# Altium schematic sheet MCU.SchDoc
size A4
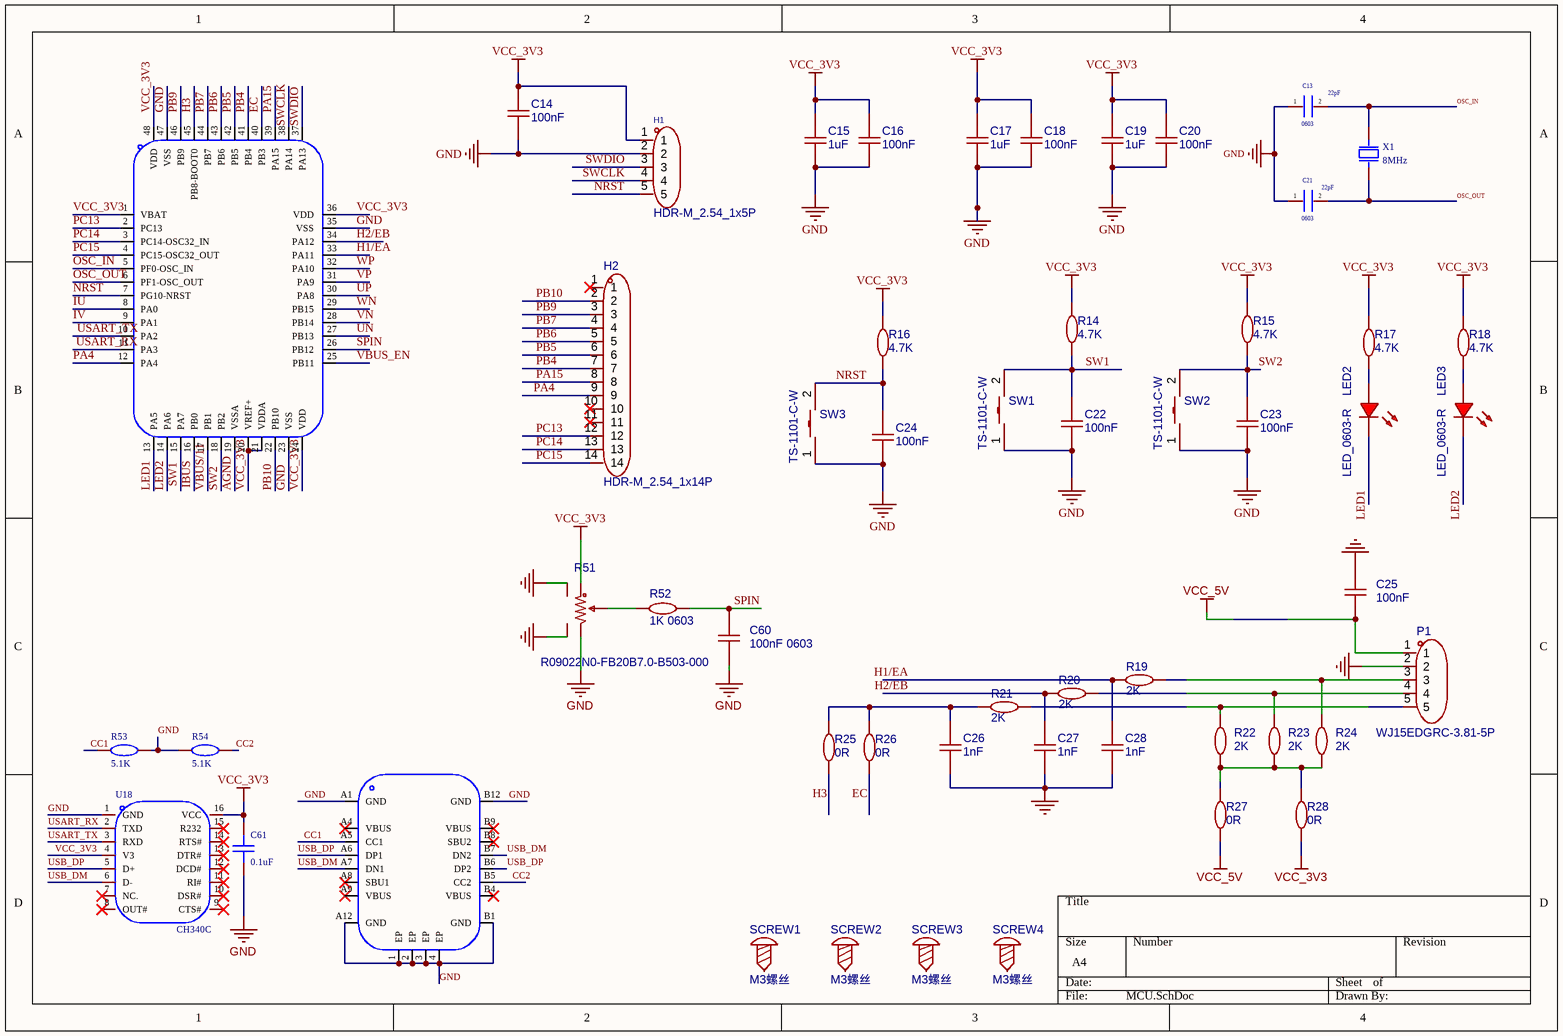
[diagram p0: MCU.SchDoc]

## Parts
C13  value 22pF  Footprint_1: 0603  [C0603]  (hidden comment: My_Library_Cap-0603)
C14  100nF  [C0603]
C15  1uF  [C0603]
C16  100nF  [C0603]
C17  1uF  [C0603]
C18  100nF  [C0603]
C19  1uF  [C0603]
C20  100nF  [C0603]
C21  value 22pF  Footprint_1: 0603  [C0603]  (hidden comment: My_Library_Cap-0603)
C22  100nF  [C0603]
C23  100nF  [C0603]
C24  100nF  [C0603]
C25  100nF  [C0603]
C26  1nF  [C0603]
C27  1nF  [C0603]
C28  1nF  [C0603]
C60  100nF 0603  [C0603]
C61  0.1uF  [C0603]
H1  HDR-M_2.54_1x5P  [HDR-TH_5P-P2.54-V-M]
H2  HDR-M_2.54_1x14P  [HDR-TH_14P-P2.54-V-M]
LED2  LED_0603-R  [LED_0603]
LED3  LED_0603-R  [LED_0603]
P1  WJ15EDGRC-3.81-5P  [CONN-TH_5P-P3.81_WJ15EDGRC-3.81-5P]
R14  4.7K  [R0603]
R15  4.7K  [R0603]
R16  4.7K  [R0603]
R17  4.7K  [R0603]
R18  4.7K  [R0603]
R19  2K  [R0603]
R20  2K  [R0603]
R21  2K  [R0603]
R22  2K  [R0603]
R23  2K  [R0603]
R24  2K  [R0603]
R25  0R  [R0603]
R26  0R  [R0603]
R27  0R  [R0603]
R28  0R  [R0603]
R51  R09022N0-FB20B7.0-B503-000  [RES-ADJ-TH_R09022N0-FB20B7B503-0004]
R52  1K 0603  [R0603]
R53  5.1K  [R0603]
R54  5.1K  [R0603]
SCREW1  M3螺丝  [PCBComponent_1 - duplicate]
SCREW2  M3螺丝  [PCBComponent_1 - duplicate]
SCREW3  M3螺丝  [PCBComponent_1 - duplicate]
SCREW4  M3螺丝  [PCBComponent_1 - duplicate]
SW1  TS-1101-C-W  [SW-SMD_L6.0-W3.3-LS8.0]
SW2  TS-1101-C-W  [SW-SMD_L6.0-W3.3-LS8.0]
SW3  TS-1101-C-W  [SW-SMD_L6.0-W3.3-LS8.0]
U5  stm32g473cbt6  [LQFP-48_L7.0-W7.0-P0.50-LS9.0-BL]  (value not drawn)
U18  CH340C  [SOP-16_L10.0-W3.9-P1.27-LS6.0-BL]
USB1  kh-type-c-16p  [USB-C-SMD_KH-TYPE-C-16P]  (value not drawn)
X1  8MHz  [CRYSTAL-SMD_L11.5-W4.8-LS12.7]

## Nets
GND: C13.1 C14.1 C15.1 C16.1 C17.1 C18.1 C19.1 C20.1 C21.1 C22.1 C23.1 C24.1 C25.2 C26.1 C27.1 C28.1 C60.2 C61.2 H1.2 P1.2 R51.3 R51.4 R51.5 R53.2 R54.1 SW1.1 SW2.1 SW3.1 U5.23(VSS) U5.35(VSS) U5.47(VSS) U18.1(GND) USB1.1(EP) USB1.2(EP) USB1.3(EP) USB1.4(EP) USB1.A1(GND) USB1.A12(GND) USB1.B1(GND) USB1.B12(GND)
VCC_3V3: C14.2 C15.2 C16.2 C17.2 C18.2 C19.2 C20.2 C61.1 H1.1 R14.2 R15.2 R16.2 R17.2 R18.2 R28.1 R51.1 U5.1(VBAT) U5.20(VREF+) U5.21(VDDA) U5.24(VDD) U5.36(VDD) U5.48(VDD) U18.4(V3) U18.16(VCC)
VCC_5V: C25.1 P1.1 R27.2
AGND: U5.19(VSSA)
CC1: R53.1 USB1.A5(CC1)
CC2: R54.2 USB1.B5(CC2)
EC: R26.1 U5.40(PB3)
H1/EA: C28.2 R19.1 U5.33(PA11)
H2/EB: C27.2 R20.1 U5.34(PA12)
H3: R25.2 U5.45(PB8-BOOT0)
IBUS: U5.16(PB0)
IU: U5.8(PA0)
IV: U5.9(PA1)
LED1: LED2.1(C) U5.13(PA5)
LED2: LED3.1(C) U5.14(PA6)
NRST: C24.2 H1.5 R16.1 SW3.2 U5.7(PG10-NRST)
OSC_IN: C13.2 U5.5(PF0-OSC_IN) X1.1(OSC1)
OSC_OUT: C21.2 U5.6(PF1-OSC_OUT) X1.2(OSC2)
PA4: H2.9 U5.12(PA4)
PA15: H2.8 U5.39(PA15)
PB4: H2.7 U5.41(PB4)
PB5: H2.6 U5.42(PB5)
PB6: H2.5 U5.43(PB6)
PB7: H2.4 U5.44(PB7)
PB9: H2.3 U5.46(PB9)
PB10: H2.2 U5.22(PB10)
PC13: H2.12 U5.2(PC13)
PC14: H2.13 U5.3(PC14-OSC32_IN)
PC15: H2.14 U5.4(PC15-OSC32_OUT)
SPIN: C60.1 R52.1 U5.26(PB12)
SW1: C22.2 R14.1 SW1.2 U5.15(PA7)
SW2: C23.2 R15.1 SW2.2 U5.18(PB2)
SWCLK: H1.4 U5.38(PA14)
SWDIO: H1.3 U5.37(PA13)
UN: U5.27(PB13)
UP: U5.30(PA8)
USART_RX: U5.11(PA3) U18.2(TXD)
USART_TX: U5.10(PA2) U18.3(RXD)
USB_DM: U18.6(D-) USB1.A7(DN1) USB1.B7(DN2)
USB_DP: U18.5(D+) USB1.A6(DP1) USB1.B6(DP2)
VBUS/11: U5.17(PB1)
VBUS_EN: U5.25(PB11)
VN: U5.28(PB14)
VP: U5.31(PA9)
WN: U5.29(PB15)
WP: U5.32(PA10)
NetC26_2: C26.2 R21.1 R25.1 R26.2
NetLED2_2: LED2.2(A) R17.1
NetLED3_2: LED3.2(A) R18.1
NetP1_3: P1.3 R19.2 R24.1
NetP1_4: P1.4 R20.2 R23.1
NetP1_5: P1.5 R21.2 R22.1
NetR22_2: R22.2 R23.2 R24.2 R27.1 R28.2
NetR51_2: R51.2 R52.2

Not connected (* = marked no-connect by the designer): H2 1* 10* 11*; SCREW1 1; SCREW2 1; SCREW3 1; SCREW4 1; U18 7(NC.)* 8(OUT#)* 9(CTS#)* 10(DSR#)* 11(RI#)* 12(DCD#)* 13(DTR#)* 14(RTS#)* 15(R232)*; USB1 A4(VBUS)* A8(SBU1)* A9(VBUS)* B4(VBUS)* B8(SBU2)* B9(VBUS)*

## Library data of the parts
C13 C21 = My_Library_Cap-0603: Origin Footprint: MyPCBLibrary:C0603; AddInBom: yes; Symbol: My_Library_Cap-0603; Device: My_Library_Cap-0603
C14 C16 C18 C20 C22-C25 C60 = CAP_0603: ConvertToPcb: yes; SymbolName: CapAcitance; ModelId: ac125912035d415993ca9572d50418b1; ModelName: C0603_L1.6-W0.8-H0.8; ModelTransform: 62.992,31.496,0,0,0,0,0,0,0; Device: CAP_0603; AddInBom: yes; Supplier Footprint: 0603; FootprintName: C0603
  C14 C16 C18 C20 C22-C25: Value: 100nF
  C60: Value: 100nF 0603
C15 C17 C19 = CAP_0603_2: ConvertToPcb: yes; SymbolName: CapAcitance; ModelId: ac125912035d415993ca9572d50418b1; ModelName: C0603_L1.6-W0.8-H0.8; ModelTransform: 62.992,31.496,0,0,0,0,0,0,0; Value: 1uF; Device: CAP_0603; AddInBom: yes; Supplier Footprint: 0603; FootprintName: C0603
C26-C28 = CAP_0603_3: ConvertToPcb: yes; SymbolName: CapAcitance; ModelId: ac125912035d415993ca9572d50418b1; ModelName: C0603_L1.6-W0.8-H0.8; ModelTransform: 62.992,31.496,0,0,0,0,0,0,0; Value: 1nF; Device: CAP_0603; AddInBom: yes; Supplier Footprint: 0603; FootprintName: C0603
C61 = CAP_0805: Symbol: Capacitance; 3D Model: 1ba041120af144c991958decab20d241聨0819f05c4eef4c71ace90d822a990e87; 3D Model Transform: 78.74,51.181,0,0,0,0,0,0.0005,0; ConvertToPcb: yes; ModelName: C0805_L2.0-W1.3-H1.3; Device: CAP_0805; Supplier Footprint: 0805; Value: 0.1uF; AddInBom: yes; FootprintName: C0603
H1 = HDR-M_2.54_1x5P: Manufacturer: MINTRON(明硕); Symbol: MTP125-1105S1; ConvertToPcb: yes; ModelId: 47d466e4a34f4fc5bc626cf773a24dd5; ModelName: HDR-TH_5P-P2.54-M-LI-1X5P; ModelTransform: 499.999,100,0,0,0,0,0,0,-118.11; Device: HDR-M_2.54_1x5P; Supplier: LCSC; Supplier Part: C358687; Manufacturer Part: MTP125-1105S1; JLCPCB Part Class: Extended Part; AddInBom: yes; Supplier Footprint: 插件; FootprintName: HDR-TH_5P-P2.54-V-M
H2 = HDR-M_2.54_1x14P: 间距:2.54mm;总PIN位数:14;排数:1;插针结构:1x14P;行距:-;安装类型:直插;圆针/方针:方针;额定电流:3A;额定电压:-;配合针长度:6mm;塑高:2.5mm;端接针长度:3mm;触头材质:-;工作温度范围:-40℃~+105℃;颜色:黑色;; Symbol: HDR_2.54-1x14P; ConvertToPcb: yes; ModelId: d38966ad4fa34699b6d9af72e76b3bd5; ModelName: HDR-TH_14P-P2.54-M-LI-1X14P; ModelTransform: 1390.155,92.913,0,0,0,0,0,0,-137.795; Device: HDR-M_2.54_1x14P; AddInBom: yes; SupplierPart: C2894937; Supplier Footprint: 插件; FootprintName: HDR-TH_14P-P2.54-V-M
LED2 LED3 = LED_0603-R: Symbol: LED_R; Convert to PCB: yes; 3D Model: dd8257b0d61a4cd7b68939a056e08095; 3D Model Transform: 58.72,29.4,22.03,0,0,0,0,0,0; ModelName: LED-0603_R; Device: LED_0603-R; Add into BOM: yes; Supplier Footprint: 0603; FootprintName: LED_0603
P1 = WJ15EDGRC-3.81-5P: 连接器类型:板端/插座-闭口;固定方式:-;结构:1x5P;间距:3.81mm;颜色:-;安装方式:弯针;排数:1;每排PIN数:5;额定电流:-;额定电压:-;线规 - AWG:-;线规 - 平方毫米:-;工作温度:-40℃~+105℃;; Manufacturer: KANGNEX(康奈克斯电气); AddInBom: yes; ModelId: 1f5bfc586d7a497a94e16b2138b9ad12; ModelName: CONN-TH_WJ3.81-WI-5P; ModelTransform: 784.64406,360.2355,0,0,0,0,-0.197,-118.11,-137.795; Number of Positions or Pins: 1x5P; Pitch: 3.81mm; Number of PINs Per Row: 5; Symbol: WJ15EDGRC-3.81-5P; Device: WJ15EDGRC-3.81-5P; LCSC Part Name: 1x5P 3.81mm 排数:1 每排P数:5; SupplierPart: C8395; ManufacturerPart: WJ15EDGRC-3.81-5P; Supplier Footprint: 弯插,P=3.81mm; JLCPCB Part Class: 扩展库; Datasheet: https://item.szlcsc.com/datasheet/WJ15EDGRC-3.81-5P/8889.html; Supplier: LCSC; ConvertToPcb: yes; FootprintName: CONN-TH_5P-P3.81_WJ15EDGRC-3.81-5P; Connector Type: 板端/插座-闭口; Termination Style: -; Color: -; Mounting Type: 弯针; Number of Pins: 5P; Number of Rows: 1; Current Rating: -; Voltage Rating (Max): -; Wire Gauge - AWG: -; Wire Gauge - mm2: -; Operating Temperature: -40℃~+105℃; Connection Type: -; Outlet Direction (Vertical Basis): -
R14-R18 = Res_0603_1: Symbol: 电阻; ConvertToPcb: yes; ModelId: fc143cca1e79419f9cd78b61e9279f08; ModelTransform: 31.8897,63.7794,0,90,0,0,0,0,0; Value: 4.7K; Device: Res_0603; AddInBom: yes; Supplier Footprint: 0603; FootprintName: R0603; ModelName: R0603
R19-R24 R52 = Res_0603: Symbol: 电阻; ConvertToPcb: yes; ModelId: fc143cca1e79419f9cd78b61e9279f08; ModelTransform: 31.8897,63.7794,0,90,0,0,0,0,0; Device: Res_0603; AddInBom: yes; Supplier Footprint: 0603; FootprintName: R0603; ModelName: R0603
  R19-R24: Value: 2K
  R52: Value: 1K 0603
R25-R28 = Res_0603: Value: 2K; Symbol: 电阻; ConvertToPcb: yes; ModelId: fc143cca1e79419f9cd78b61e9279f08; ModelTransform: 31.8897,63.7794,0,90,0,0,0,0,0; Device: Res_0603; AddInBom: yes; Supplier Footprint: 0603; FootprintName: R0603; ModelName: R0603
R51 = R09022N0-FB20B7.0-B503-000: 可调电阻旋转电位器; Manufacturer: CTR(长泰尔电子); AddInBom: yes; ModelId: 71d2ca23f0844f7d968f95a814dfb0e2; ModelTransform: 450.24737,500.038,0,0,0,0,0,104.055,-149.606; Voltage Rating: 10V; Symbol: R09022N0-FB20B7.0-B503-000; Device: R09022N0-FB20B7.0-B503-000; LCSC Part Name: R09022N0-FB20B7.0-B503-000; SupplierPart: C18213417; ManufacturerPart: R09022N0-FB20B7.0-B503-000; Supplier Footprint: 插件; JLCPCB Part Class: 扩展库; Datasheet: https://atta.szlcsc.com/upload/public/pdf/source/20231010/93ED3CE9FDD6AC93F067D89ACCCFD006.pdf; Supplier: LCSC; ConvertToPcb: yes; FootprintName: RES-ADJ-TH_R09022N0-FB20B7B503-0004; ModelName: RES-ADJ-TH_R09022N0-FB20B7B503-0004
R53 R54 = Res_0603: Symbol: 电阻; 3D Model: fc143cca1e79419f9cd78b61e9279f08聨0819f05c4eef4c71ace90d822a990e87; 3D Model Transform: 31.8897,63.7794,0,90,0,0,0,0,0; ConvertToPcb: yes; Device: Res_0603; Supplier Footprint: 0603; Value: 5.1K; AddInBom: yes; FootprintName: R0603; ModelName: R0603
SCREW1-SCREW4 = M3螺丝: ConvertToPcb: yes; SymbolName: 螺丝孔; Device: M3螺丝; AddInBom: yes; Supplier Footprint: 插件; FootprintName: M3螺丝
SW1-SW3 = TS-1101-C-W: 电路结构:单刀单掷;按钮形状:矩形按钮;作用力:260gf;安装方式:立贴;开关长度:6mm;开关宽度:3.6mm;开关高度:2.5mm;带支架:不带;触点电流:50mA;额定电压(AC):-;额定电压(DC):12V;额定功率:-;绝缘电阻:-;带灯:无;机械寿命:5万次;; Manufacturer: XKB Connectivity(中国星坤); AddInBom: yes; ModelId: b2f4ea9f0afc4b0786d53dba66ceb9e4; ModelName: SW-SMD_L6.0-W3.3-H5-LS8.0; ModelTransform: 314.96,129.921,0,0,0,0,0,0,0; Circuit: 单刀单掷; Actuator Style: 矩形按钮; Operating Force: 260gf; Switch Length: 6mm; Switch Width: 3.6mm; Switch Height: 2.5mm; Strike Gundam: 不带; Contact Current: 50mA; Voltage Rating (DC): 12V; Actuator/Cap Color: 白色带淡绿; With Lamp: 无; Mechanical Life: 5万次; Symbol: TS-1101-C-W; Device: TS-1101-C-W; LCSC Part Name: 6*3.6*2.5mm 立贴 轻触开关; SupplierPart: C318938; ManufacturerPart: TS-1101-C-W; Supplier Footprint: SMD; JLCPCB Part Class: 扩展库; Datasheet: https://atta.szlcsc.com/upload/public/pdf/source/20200227/C318938_C2E53B1EEDE37D980A33616AC086DE53.pdf; Supplier: LCSC; ConvertToPcb: yes; FootprintName: SW-SMD_L6.0-W3.3-LS8.0; Mounting Style: 立贴; Voltage Rating (AC): -; Power Rating: -; Insulation Resistance: -; IP Rating: -; Pin Style: -; Operating Temperature: -30℃~+85℃
U5 = stm32g473cbt6: CPU内核:ARM Cortex-M4;CPU最大主频:170MHz;CPU位数:32 Bit;; Manufacturer: ST(意法半导体); AddInBom: yes; ModelId: 093be70396ff421eb2cdb946d5311efc; ModelName: LQFP-48_L7.0-W7.0-H1.4-LS9.0-P0.50; ModelTransform: 354.331,354.331,0,0,0,0,0,0,0; CPU Maximum Speed: 170MHz; Core Size: 32 Bit; Program Storage Size: 128KB; Program Memory Type: FLASH; Number of I/O: 38; Oscillator Type: 内置+外置; Voltage - Supply: 1.71V~3.6V; Symbol: STM32G473CBT6; LCSC Part Name: 带DSP和FPU的170MHz主流ARM Cortex-M4 MCU，具有128 KB Flash存储器、数学加速器和高模拟电平集成; SupplierPart: C730111; ManufacturerPart: STM32G473CBT6; Supplier Footprint: LQFP-48(7x7); JLCPCB Part Class: Extended Part; Datasheet: https://item.szlcsc.com/datasheet/STM32G473CBT6/778066.html; Supplier: LCSC; ConvertToPcb: yes; FootprintName: LQFP-48_L7.0-W7.0-P0.50-LS9.0-BL; CPU Core: ARM Cortex-M4; RAM Size: 128KB; EEPROM: -; Operating Temperature: -40℃~+85℃
U18 = CH340C: 应用功能:收发器;USB协议版本:USB 2.0;通道数:-;数据速率:2Mbps;; Manufacturer: WCH(南京沁恒); 3D Model: 3361a6792abf4a8f8fbca4f1924a67ee聨0819f05c4eef4c71ace90d822a990e87; 3D Model Transform: 240.39054,393.7,0,90,0,0,0,0,0; Applications Function: 收发器; USB Protocol: USB 2.0; Voltage - Supply: 3.3V；5V; Data Rate: 2Mbps; Current - Supply: 7mA; Quiescent Supply Current: 50uA; AddInBom: yes; ModelName: SOP-16_L9.9-W3.9-H1.5-LS6.0-P1.27; Symbol: CH340C; Device: CH340C; LCSC Part Name: USB转串口芯片; Supplier Part: C84681; Manufacturer Part: CH340C; Supplier Footprint: SOP-16; JLCPCB Part Class: Extended Part; Datasheet: https://item.szlcsc.com/datasheet/CH340C/85852.html; Supplier: LCSC; Number of Channels: -; Operating Temperature: -20℃~+70℃; Features: 可编程波特率；内置时钟发生器；上电复位; ConvertToPcb: yes; FootprintName: SOP-16_L10.0-W3.9-P1.27-LS6.0-BL
USB1 = kh-type-c-16p: 连接器类型:Type-C;协议标准:-;公母:母;安装方式:卧贴;触点数量:16P;端口数量:1;额定电流 - 电源:3A;工作温度:-40℃~+85℃;; Manufacturer: kinghelm(金航标); AddInBom: yes; ModelId: f2c381012fbf47e0b76dea5162270f01; ModelTransform: 351.9678,307.48,0,0,0,0,0,-45.276,-43.307; Connector Type: Type-C; Gender: 母; Number of Contacts: 16P; Number of Ports: 1; Current Rating-Power: 3A; Voltage Rating: 30V; Connect-Disconnect Life: 1万次; Symbol: KH-TYPE-C-16P; LCSC Part Name: Type-C 母 卧贴; SupplierPart: C709357; ManufacturerPart: KH-TYPE-C-16P; Supplier Footprint: SMD; JLCPCB Part Class: Extended Part; Datasheet: https://item.szlcsc.com/datasheet/KH-TYPE-C-16P/747093.html; Supplier: LCSC; ConvertToPcb: yes; FootprintName: USB-C-SMD_KH-TYPE-C-16P; ModelName: USB-C-SMD_KH-TYPE-C-16P; Protocol Standard: -; Mounting Type: 卧贴; Length: 7.81mm; Operating Temperature: -40℃~+85℃
X1 = X49SM8MSD2SC: 晶振类型:贴片晶振;频率:8MHz;常温频差:±20ppm;负载电容:20pF;频率稳定度:±30ppm;; Manufacturer: YXC(扬兴晶振); 3D Model: 6f569b91267b44029b8615eb5c810fba聨0819f05c4eef4c71ace90d822a990e87; 3D Model Transform: 499.999,188.976,0,180,0,0,0.002,-0.002,0; Normal temperature Frequency Tolerance: ±20ppm; Load Capacitance: 20pF; Frequency Stability: ±30ppm; AddInBom: yes; ModelName: HC-49S_L11.4-W1.8-H3.0-LS12.7; Symbol: X49SM8MSD2SC; Device: X49SM8MSD2SC; LCSC Part Name: HC-49SMD 8MHZ 20PF ±20PPM -20~70℃（±30PPM）; Supplier Part: C12674; Manufacturer Part: X49SM8MSD2SC; Supplier Footprint: HC-49S-SMD; JLCPCB Part Class: Basic Part; Datasheet: https://item.szlcsc.com/datasheet/X49SM8MSD2SC/13310.html; Supplier: LCSC; Type: 贴片晶振; Value: 8MHz; Operating Temperature: -20℃~+70℃; ConvertToPcb: yes; FootprintName: CRYSTAL-SMD_L11.5-W4.8-LS12.7